# Altium schematic sheet Tor.SchDoc
size A3; DrawnBy: Krzysztof Kaczmarczyk
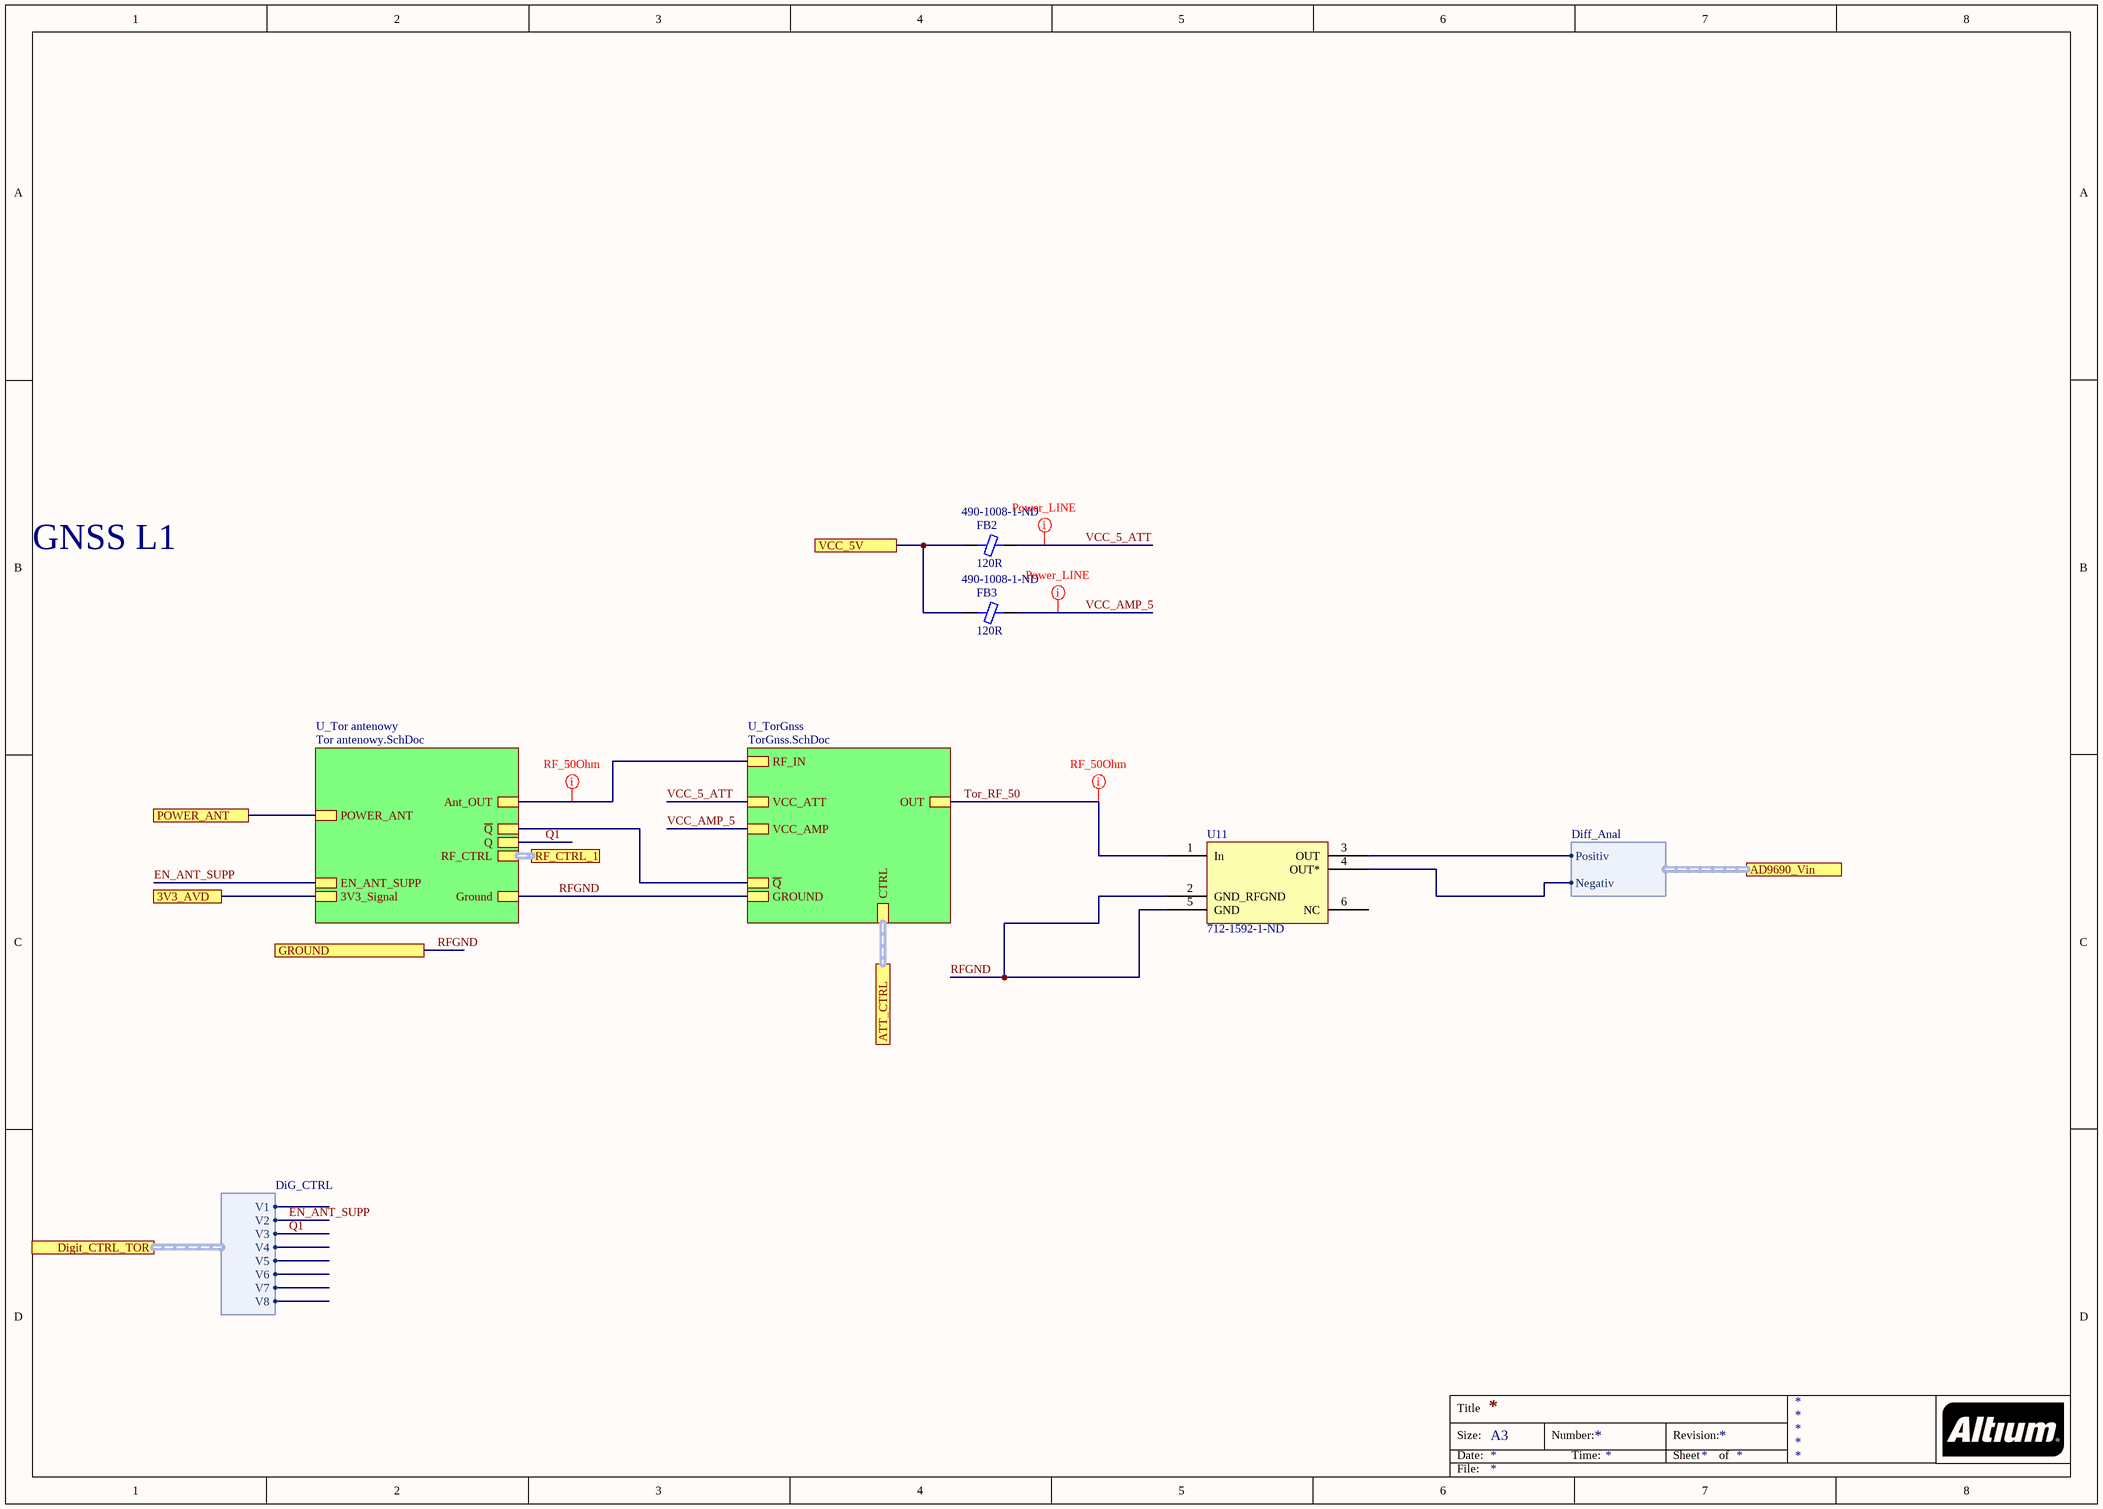
[diagram p0: Tor.SchDoc]

## Parts
FB2  120R  Supplier Part Number 1: 490-1008-1-ND  [FER 0402/1005 KK]
FB3  120R  Supplier Part Number 1: 490-1008-1-ND  [FER 0402/1005 KK]
U11  Supplier Part Number 1: 712-1592-1-ND  [1600BL15B100]  (hidden comment: 1720BL15A0100E)

## Sub-sheets
U_Tor antenowy = Tor antenowy.SchDoc: Ant_OUT, Ground, POWER_ANT, EN_ANT_SUPP, 3V3_Signal, Q, ~{Q}, RF_CTRL (harness RF_CTRL)
U_TorGnss = TorGnss.SchDoc: VCC_ATT, GROUND, VCC_AMP, OUT, RF_IN, CTRL, ~{Q}

## Ports
3V3_AVD, AD9690_Vin (harness Diff_Anal), ATT_CTRL (harness ATT_Controle), Digit_CTRL_TOR (harness DiG_CTRL), GROUND, POWER_ANT, RF_CTRL_1, VCC_5V

## Harnesses
Diff_Anal: Positiv, Negativ
DiG_CTRL: V1, V2, V3, V4, V5, V6, V7, V8

## Nets
3V3_AVD: port 3V3_AVD, sheet U_Tor antenowy/3V3_Signal
EN_ANT_SUPP: sheet U_Tor antenowy/EN_ANT_SUPP, port Digit_CTRL_TOR.V2
POWER_ANT: port POWER_ANT, sheet U_Tor antenowy/POWER_ANT
Q1: sheet U_Tor antenowy/Q, port Digit_CTRL_TOR.V3
RFGND: U11.2(GND_RFGND) U11.5(GND) ; port GROUND, sheet U_TorGnss/GROUND, sheet U_Tor antenowy/Ground
Tor_RF_50: U11.1(In) ; sheet U_TorGnss/OUT
VCC_5_ATT: FB2.2 ; sheet U_TorGnss/VCC_ATT
VCC_5V: FB2.1 FB3.1 ; port VCC_5V
VCC_AMP_5: FB3.2 ; sheet U_TorGnss/VCC_AMP
NetU11_3: U11.3(OUT) ; port AD9690_Vin.Positiv
NetU11_4: U11.4(OUT*) ; port AD9690_Vin.Negativ
(unnamed): sheet U_TorGnss/RF_IN, sheet U_Tor antenowy/Ant_OUT
(unnamed): sheet U_TorGnss/~{Q}, sheet U_Tor antenowy/~{Q}

Not connected (* = marked no-connect by the designer): U11 6(NC)

## Buses and harness runs
harness port ATT_CTRL = sheet U_TorGnss/CTRL
harness port RF_CTRL_1 = sheet U_Tor antenowy/RF_CTRL

## Layout directives
net class Power_LINE: VCC_5_ATT, VCC_AMP_5
net class Single50: (no net found under the mark), Tor_RF_50

## Notes on the sheet
- GNSS L1
- Title
- Size:
- Date:
- A3
- Number:
- Time:
- Revision:
- Sheet
- of
- File:

## Library data of the parts
FB2 FB3 = Ferrite: Manufacturer 1: Murata; Manufacturer Part Number 1: BLM15BB121SN1D; Material: Ferrite,Steel; Tolerance: 25%; Current Rating: 300mA; DC Resistance (DCR): 550mR; Test Frequency: 100MHz; Shielding: Unshielded; Number of Lines: 1; Supplier 1: Digi-Key; Stock 1: 178432; Pricing 1: 1=0.10000, 10=0.08300, 25=0.07440, 50=0.05440, 100=0.04700, 250=0.03712, 500=0.03136, 1000=0.02640, 5000=0.02351 (USD); RoHS: Yes; Case/Package: 0402; Number of Pins: 2; Case Code (Metric): 1005; Case Code (Imperial): 0402; Core Material: Ferrite; Min Operating Temperature: -55°C; Max Operating Temperature: 125°C; Package Quantity: 1; Packaging: Tape and Reel; Max DC Current: 300mA; Termination: SMD/SMT; Frequency: 100MHz; Composition: Ferrite Bead; Impedance: 120R; Max Current Rating: 300mA; Number of Circuits: 1; Length: 1mm; Height: 0.5mm; Width: 0.5mm; Depth: 0.5mm; Lead Free: Lead Free; REACH SVHC: No SVHC; ComponentLink1URL: https://datasheet.ciiva.com/1466/5145-1466832.pdf?src-supplier=Element14; ComponentLink1Description: https://datasheet.ciiva.com/1466/5145-1466832.pdf?src-supplier=Element14; ComponentLink2URL: https://datasheet.ciiva.com/41449/001172179-da-01-en-drossel-0402-120r-1-0x0-5mm-10000st-41449466.pdf?src-supplier=Conrad; ComponentLink2Description: https://datasheet.ciiva.com/41449/001172179-da-01-en-drossel-0402-120r-1-0x0-5mm-10000st-41449466.pdf?src-supplier=Conrad; ComponentLink3URL: https://datasheet.ciiva.com/1466/5145-1466833.pdf?src-supplier=Element14; ComponentLink3Description: https://datasheet.ciiva.com/1466/5145-1466833.pdf?src-supplier=Element14; ComponentLink4URL: https://datasheet.ciiva.com/3082/l0110s0100blm15b-3082680.pdf?src-supplier=Avnet; ComponentLink4Description: https://datasheet.ciiva.com/3082/l0110s0100blm15b-3082680.pdf?src-supplier=Avnet; ComponentLink5URL: https://datasheet.ciiva.com/16213/l0110s0100blm15b-16213674.pdf?src-supplier=Future+Electronics; ComponentLink5Description: https://datasheet.ciiva.com/16213/l0110s0100blm15b-16213674.pdf?src-supplier=Future+Electronics; ComponentLink6URL: https://datasheet.ciiva.com/1012/l0110s0100blm15b-1012029.pdf?src-supplier=Digi-Key; ComponentLink6Description: https://datasheet.ciiva.com/1012/l0110s0100blm15b-1012029.pdf?src-supplier=Digi-Key; ComponentLink7URL: https://datasheet.ciiva.com/1012/l0110s0100blm15b-1012030.pdf?src-supplier=Digi-Key; ComponentLink7Description: https://datasheet.ciiva.com/1012/l0110s0100blm15b-1012030.pdf?src-supplier=Digi-Key; ComponentLink8URL: https://datasheet.ciiva.com/1012/l0110s0100blm15b-1012031.pdf?src-supplier=Digi-Key; ComponentLink8Description: https://datasheet.ciiva.com/1012/l0110s0100blm15b-1012031.pdf?src-supplier=Digi-Key
U11 = 1720BL15A0100E: BALUN 625MHZ-2.8GHZ 50/100 0805; Manufacturer: Johanson; Supplier 1: Digi-Key; Manufacturer Part Number: 1720BL15A0100E; RoHS: Yes; Stock 1: 10440; Pricing 1: 1=0,64000, 10=0,62500, 25=0,41840, 50=0,37240, 100=0,34110, 250=0,30600, 500=0,29962, 1000=0,21675 (USD); Mount: Surface Mount; Case/Package: 0805; Case Code (Imperial): 0805; Case Code (Metric): 2012; Packaging: Tape and Reel; ComponentLink1URL: http://www.mouser.com/ds/2/611/1720BL15A0100-910138.pdf?src-supplier=Mouser; ComponentLink1Description: http://www.mouser.com/ds/2/611/1720BL15A0100-910138.pdf?src-supplier=Mouser; ComponentLink2URL: https://www.johansontechnology.com/datasheets/baluns/1720BL15A0100.pdf?src-supplier=Digi-Key; ComponentLink2Description: https://www.johansontechnology.com/datasheets/baluns/1720BL15A0100.pdf?src-supplier=Digi-Key; ComponentLink3URL: https://www.johansontechnology.com/datasheets/1720BL15A0100/1720BL15A0100.pdf?src-supplier=Digi-Key; ComponentLink3Description: https://www.johansontechnology.com/datasheets/1720BL15A0100/1720BL15A0100.pdf?src-supplier=Digi-Key